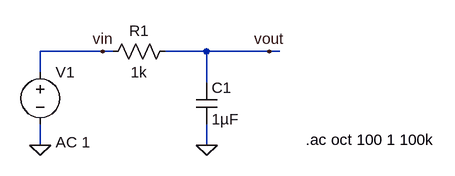
[diagram p0: schematic ac_analysis_test.asc]
ac_analysis_test.asc, the LTspice schematic file:
Version 4
SHEET 1 880 680
WIRE 64 112 -32 112
WIRE 80 112 64 112
WIRE 224 112 160 112
WIRE 320 112 224 112
WIRE 336 112 320 112
WIRE -32 144 -32 112
WIRE 224 160 224 112
WIRE -32 256 -32 224
WIRE 224 256 224 224
FLAG 320 112 vout
FLAG 64 112 vin
FLAG 224 256 0
FLAG -32 256 0
SYMBOL res 176 96 R90
WINDOW 0 0 56 VBottom 2
WINDOW 3 32 56 VTop 2
SYMATTR InstName R1
SYMATTR Value 1k
SYMBOL cap 208 160 R0
SYMATTR InstName C1
SYMATTR Value 1µF
SYMBOL voltage -32 128 R0
WINDOW 123 24 124 Left 2
WINDOW 39 0 0 Left 2
SYMATTR InstName V1
SYMATTR Value ""
SYMATTR Value2 AC 1
TEXT 376 248 Left 2 !.ac oct 100 1 100k

The netlist it stands for:
* ac_analysis_test.asc
R1 vout vin 1k
C1 vout 0 1µF
V1 vin 0 AC 1
.ac oct 100 1 100k
.backanno
.end